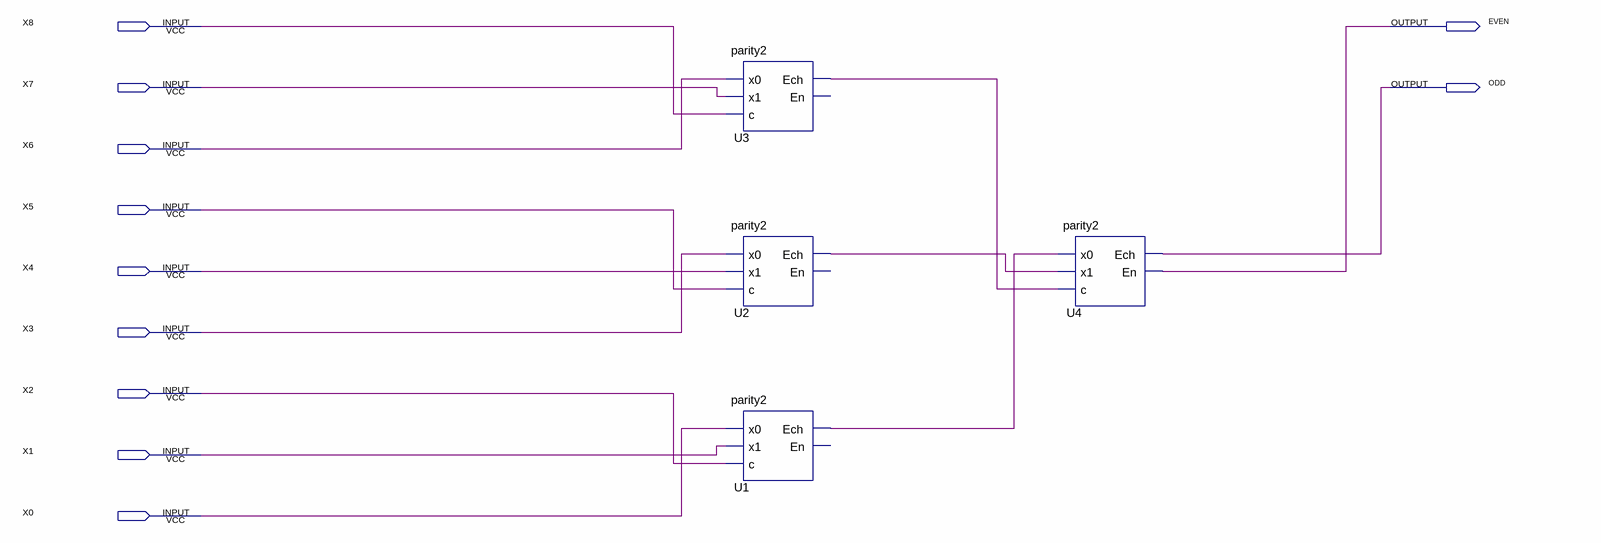
[diagram p0: schematic sheet]
// Quartus schematic eo8.bdf as structural Verilog: 4 symbols, 11 pins
module eo8 (
  input  X8,
  input  X7,
  input  X6,
  input  X5,
  input  X4,
  input  X3,
  input  X2,
  input  X1,
  input  X0,
  output EVEN,
  output ODD
);

  wire U1_ech, U2_ech, U3_ech;

  parity2 U3 (.x0(X6), .x1(X7), .c(X8), .Ech(U3_ech));  // open: En
  parity2 U2 (.x0(X3), .x1(X4), .c(X5), .Ech(U2_ech));  // open: En
  parity2 U1 (.x0(X0), .x1(X1), .c(X2), .Ech(U1_ech));  // open: En
  parity2 U4 (.x0(U1_ech), .x1(U2_ech), .c(U3_ech), .Ech(ODD), .En(EVEN));
endmodule
